# Altium project OpenOBW.PrjPcb
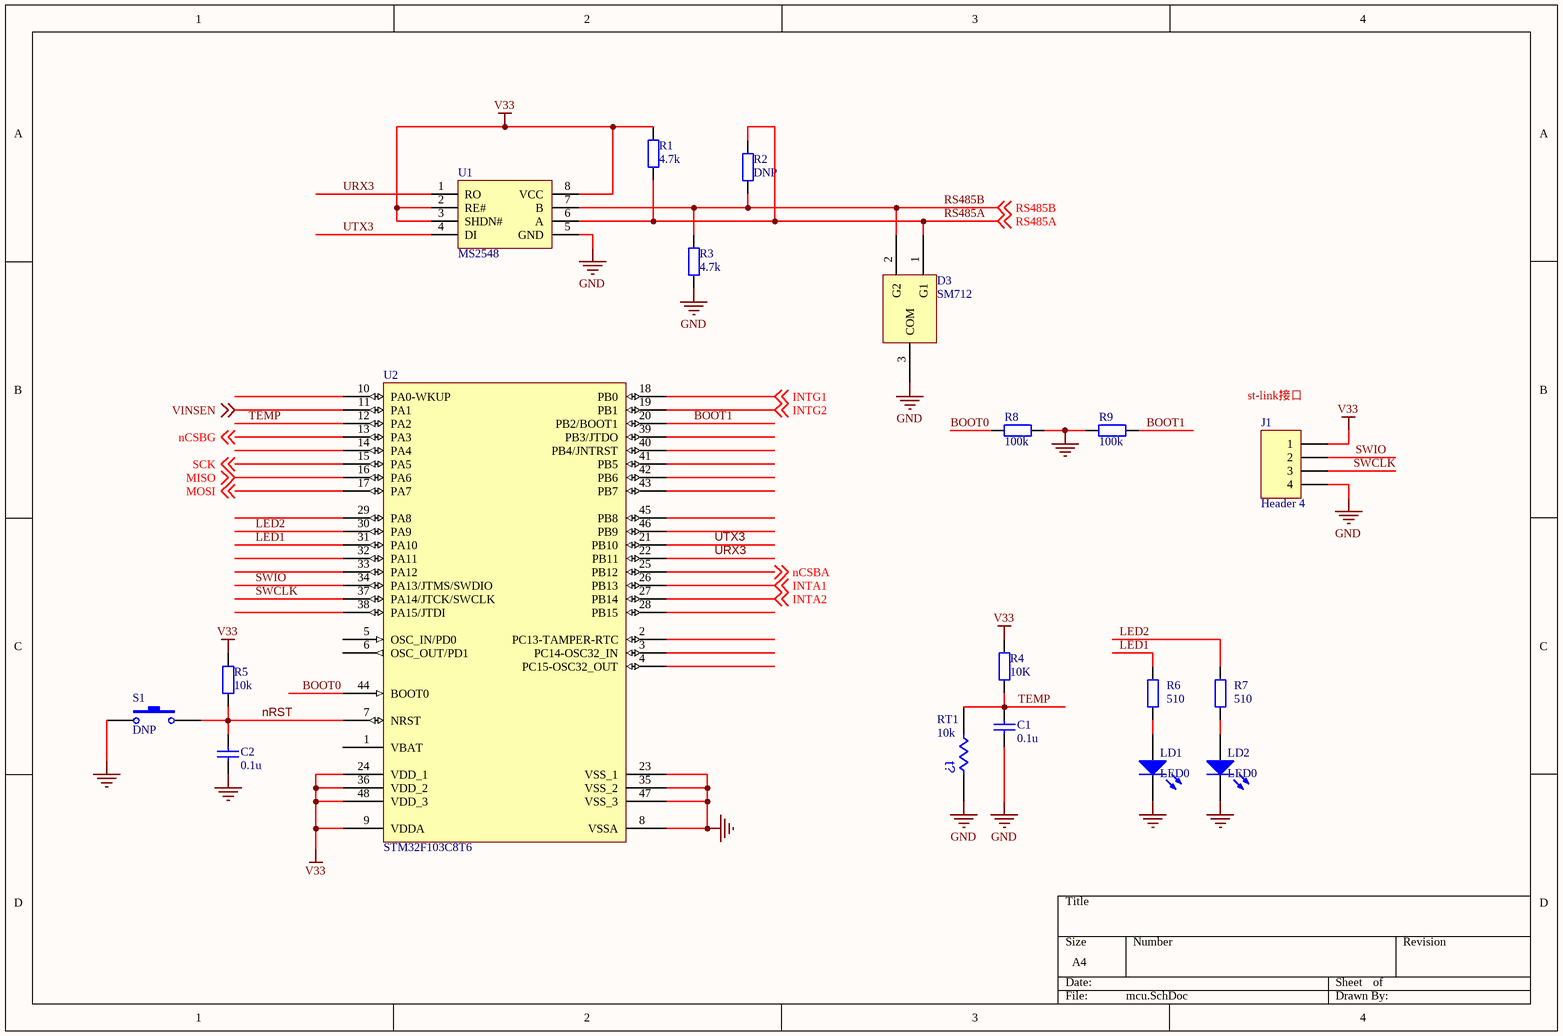
[diagram p0: mcu.SchDoc]
3 sheets, 43 parts. Net scope: global (net labels, ports and power ports of the same name join across sheets).
Board file: OpenOBW.PcbDoc
Sheets:
  mcu.SchDoc
  power.SchDoc
  imu.SchDoc

## Sheet mcu.SchDoc
size A4; SPICEModelCacheXRGICAAV: <root> / <DocumentId>XRGICAAV</DocumentId> / </root>

### Parts
C1  value 0.1u  [0603C]  (hidden comment: Cap)
C2  value 0.1u  [0603C]  (hidden comment: Cap)
D3  SM712  [sot-23]
J1  Header 4  [xhb127-4]
LD1  LED0  [0603d-s]
LD2  LED0  [0603d-s]
R1  value 4.7k  [0603R]  (hidden comment: Res2)
R2  value DNP  [0603R]  (hidden comment: Res2)
R3  value 4.7k  [0603R]  (hidden comment: Res2)
R4  value 10K  [0603R]  (hidden comment: Res2)
R5  value 10k  [0603R]  (hidden comment: Res2)
R6  value 510  [0603R]  (hidden comment: Res2)
R7  value 510  [0603R]  (hidden comment: Res2)
R8  value 100k  [0603R]  (hidden comment: Res2)
R9  value 100k  [0603R]  (hidden comment: Res2)
RT1  10k  [0603R]
S1  DNP  [0603R]
U1  MS2548  [SOIC127P600-8AM]
U2  STM32F103C8T6  [TSQFP50P900X900-48M]

### Nets
GND: C1.1 C2.1 D3.3(COM) J1.4 LD1.2(K) LD2.2(K) R3.1 R8.2 R9.1 RT1.1 S1.1 U1.5(GND) U2.8(VSSA) U2.23(VSS_1) U2.35(VSS_2) U2.47(VSS_3)
V33: J1.1 R1.1 R4.1 R5.2 U1.2(RE#) U1.3(SHDN#) U1.8(VCC) U2.9(VDDA) U2.24(VDD_1) U2.36(VDD_2) U2.48(VDD_3)
BOOT0: R8.1 U2.44(BOOT0)
BOOT1: R9.2 U2.20(PB2/BOOT1)
INTA1: U2.26(PB13) ; off-sheet INTA1
INTA2: U2.27(PB14) ; off-sheet INTA2
INTG1: U2.18(PB0) ; off-sheet INTG1
INTG2: U2.19(PB1) ; off-sheet INTG2
LED1: R6.2 U2.31(PA10)
LED2: R7.2 U2.30(PA9)
MISO: U2.16(PA6) ; off-sheet MISO
MOSI: U2.17(PA7) ; off-sheet MOSI
nCSBA: U2.25(PB12) ; off-sheet nCSBA
nCSBG: U2.13(PA3) ; off-sheet nCSBG
nRST: C2.2 R5.1 S1.2 U2.7(NRST)
RS485A: D3.1(G1) R1.2 R2.2 U1.6(A) ; off-sheet RS485A
RS485B: D3.2(G2) R2.1 R3.2 U1.7(B) ; off-sheet RS485B
SCK: U2.15(PA5) ; off-sheet SCK
SWCLK: J1.3 U2.37(PA14/JTCK/SWCLK)
SWIO: J1.2 U2.34(PA13/JTMS/SWDIO)
TEMP: C1.2 R4.2 RT1.2 U2.12(PA2)
URX3: U1.1(RO) U2.22(PB11)
UTX3: U1.4(DI) U2.21(PB10)
VINSEN: U2.11(PA1) ; off-sheet VINSEN
NetLD1_1: LD1.1(A) R6.1
NetLD2_1: LD2.1(A) R7.1

Not connected (* = marked no-connect by the designer): U2 1(VBAT) 2(PC13-TAMPER-RTC) 3(PC14-OSC32_IN) 4(PC15-OSC32_OUT) 5(OSC_IN/PD0) 6(OSC_OUT/PD1) 10(PA0-WKUP) 14(PA4) 28(PB15) 29(PA8) 32(PA11) 33(PA12) 38(PA15/JTDI) 39(PB3/JTDO) 40(PB4/JNTRST) 41(PB5) 42(PB6) 43(PB7) 45(PB8) 46(PB9)

### Notes on the sheet
- (near J1) st-link接口
- (in symbol Res Thermal) t?

### Library data of the parts
C1 C2 = Cap: Capacitor; Published: 8-Jun-2000; LatestRevisionDate: 17-Jul-2002; LatestRevisionNote: Re-released for DXP Platform.; PackageReference: RAD-0.3; Publisher: Altium Limited; PackageDescription: Radial Cap, Thru-Hole; 2 Leads; 0.3 in Pin Spacing
D3 = SM712: 7V/12V TVS diodes
J1 = Header 4: Header, 4-Pin; LatestRevisionDate: 17-Jul-2002; LatestRevisionNote: Re-released for DXP Platform.; Publisher: Altium Limited
LD1 LD2 = LED0: Typical INFRARED GaAs LED; Published: 8-Jun-2000; LatestRevisionDate: 08-Jul-2005; LatestRevisionNote: Mech Layer 1 removed.; PackageReference: LED-0; Publisher: Altium Limited; PackageDescription: LED; 2 Leads
R1-R9 = Res2: Resistor; Published: 8-Jun-2000; LatestRevisionDate: 17-Jul-2002; LatestRevisionNote: Re-released for DXP Platform.; PackageReference: AXIAL-0.4; Publisher: Altium Limited; PackageDescription: Axial Device, Thru-Hole; 2 Leads; 0.4 in Pin Spacing
RT1 = Res Thermal: Thermistor; Published: 24-Mar-1999; LatestRevisionDate: 29-May-2009; LatestRevisionNote: IPC-7351 Footprint Added.; PackageVersion: Mar-2003; PackageReference: 6-0805; Publisher: Altium Limited; PackageDescription: Chip Resistor 0805 Case Size; Code_IPC: RESC2012
S1 = SW-PB: Switch; Published: 24-Mar-1999; LatestRevisionDate: 17-Jul-2002; LatestRevisionNote: Re-released for DXP Platform.; PackageReference: SPST-2; Publisher: Altium Limited; PackageDescription: Switch; 2 Leads
U1 = MAX13487
U2 = STM32F101C8T6: STM32 ARM-based 32-bit MCU with 64 Kbytes Flash, 48-pin LQFP, Industrial Temperature; Published: 30-May-2008; DatasheetVersion: rev6, Mar-2008; PackageVersion: Mar-2008; PackageReference: LQFP48; Publisher: Altium Limited; PackageDescription: 48-Pin Low-Profile Quad Flat Pack, 7 x 7 mm Body, 0.5 mm Pitch (LQFP48); ComponentLink1Description: Manufacturer Link; ComponentLink1URL: www.st.com/stm32; ComponentLink2Description: Datasheet; ComponentLink2URL: http://www.st.com/stonline/products/literature/ds/13586.pdf

## Sheet power.SchDoc
size A4
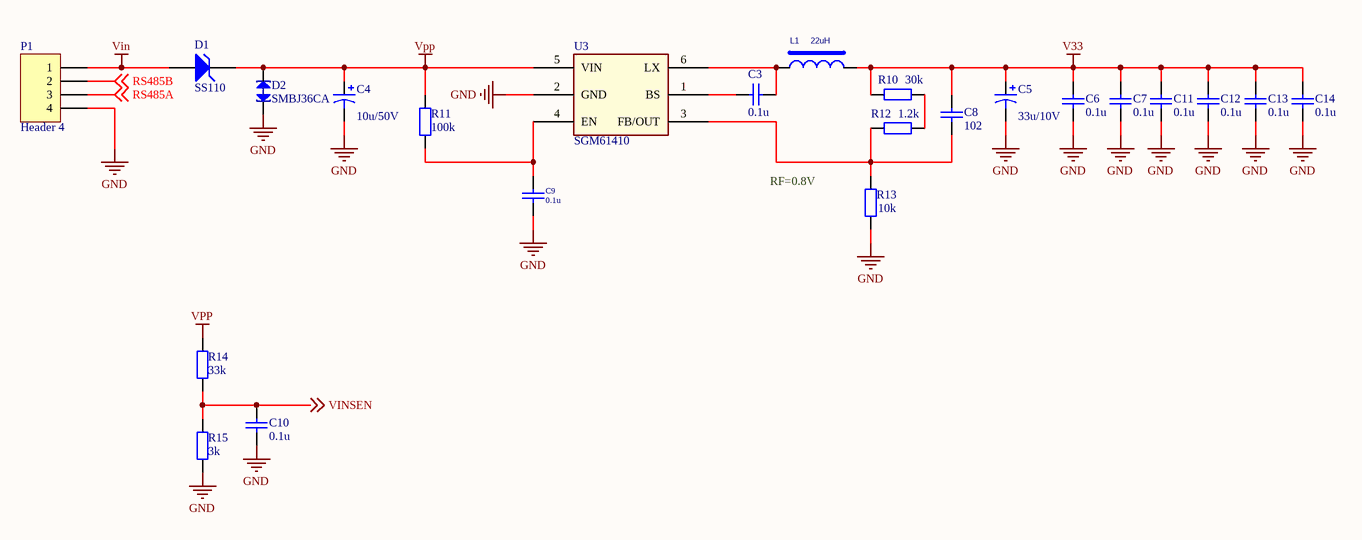
[diagram p1: power.SchDoc]

### Parts
C3  value 0.1u  [0603C]  (hidden comment: Cap)
C4  value 10u/50V  [E0.1]  (hidden comment: Cap Pol1)
C5  value 33u/10V  [E0.1]  (hidden comment: Cap Pol1)
C6  value 0.1u  [0603C]  (hidden comment: Cap)
C7  value 0.1u  [0603C]  (hidden comment: Cap)
C8  value 102  [0603C]  (hidden comment: Cap)
C9  value 0.1u  [0603C]  (hidden comment: Cap)
C10  value 0.1u  [0603C]  (hidden comment: Cap)
C11  value 0.1u  [0603C]  (hidden comment: Cap)
C12  value 0.1u  [0603C]  (hidden comment: Cap)
C13  value 0.1u  [0603C]  (hidden comment: Cap)
C14  value 0.1u  [0603C]  (hidden comment: Cap)
D1  SS110  [SMB]
D2  SMBJ36CA  [SMB]
L1  22uH  [MSS4018]
P1  Header 4  [HDR1X4]
R10  value 30k  [0603R]  (hidden comment: Res2)
R11  value 100k  [0603R]  (hidden comment: Res2)
R12  value 1.2k  [0603R]  (hidden comment: Res2)
R13  value 10k  [0603R]  (hidden comment: Res2)
R14  value 33k  [0603R]  (hidden comment: Res2)
R15  value 3k  [0603R]  (hidden comment: Res2)
U3  SGM61410  [sot-26]

### Nets
GND: C4.2 C5.2 C6.1 C7.1 C9.2 C10.1 C11.1 C12.1 C13.1 C14.1 D2.1(A) P1.4 R13.2 R15.1 U3.2(GND)
V33: C5.1 C6.2 C7.2 C8.2 C11.2 C12.2 C13.2 C14.2 L1.2 R10.1
Vin: D1.1(A) P1.1
VPP: C4.1 D1.2(K) D2.2(A) R11.1 R14.2 U3.5(VIN)
RS485A: P1.3 ; off-sheet RS485A
RS485B: P1.2 ; off-sheet RS485B
VINSEN: C10.2 R14.1 R15.2 ; off-sheet VINSEN
NetC3_1: C3.1 L1.1 U3.6(LX)
NetC3_2: C3.2 U3.1(BS)
NetC8_1: C8.1 R12.1 R13.1 U3.3(FB/OUT)
NetC9_1: C9.1 R11.2 U3.4(EN)
NetR10_2: R10.2 R12.2

### Notes on the sheet
- RF=0.8V

### Library data of the parts
C3 C6-C14 = Cap: Capacitor; Published: 8-Jun-2000; LatestRevisionDate: 17-Jul-2002; LatestRevisionNote: Re-released for DXP Platform.; PackageReference: RAD-0.3; Publisher: Altium Limited; PackageDescription: Radial Cap, Thru-Hole; 2 Leads; 0.3 in Pin Spacing
C4 C5 = Cap Pol1: Polarized Capacitor (Radial); Published: 8-Jun-2000; LatestRevisionDate: 17-Jul-2002; LatestRevisionNote: Re-released for DXP Platform.; PackageReference: RB7.6-15; Publisher: Altium Limited; PackageDescription: Polarized Capacitor (Radial); 2 Leads
D1 = D Zener: Zener Diode; Published: 8-Jun-2000; LatestRevisionDate: 17-Jul-2002; LatestRevisionNote: Re-released for DXP Platform.; PackageReference: DIODE-0.7; Publisher: Altium Limited; PackageDescription: Diode, Thru-Hole; 2 Leads; 0.7 in Pin Spacing
D2 = TVS_B
L1 = INDUCTORS OF FERRITE: Power Inductor,3.3uH,0.2,IND_404030; Manufacturer PN: SWPA4030S3R3MT; Manufacturer: sunlord; DC Resistor: 0.04ohm; Isat: 3.3A; Resonace frequency: 38M; Irms: 2.4A; Tolerance: 20%; Priority: A; Created by: YTL; Part Type: POWER_IND; RK PN: SWPA4030S3R3MT
P1 = Header 4: Header, 4-Pin; LatestRevisionDate: 17-Jul-2002; LatestRevisionNote: Re-released for DXP Platform.; Publisher: Altium Limited
R10-R15 = Res2: Resistor; Published: 8-Jun-2000; LatestRevisionDate: 17-Jul-2002; LatestRevisionNote: Re-released for DXP Platform.; PackageReference: AXIAL-0.4; Publisher: Altium Limited; PackageDescription: Axial Device, Thru-Hole; 2 Leads; 0.4 in Pin Spacing
U3 = RY8310

## Sheet imu.SchDoc
size A4
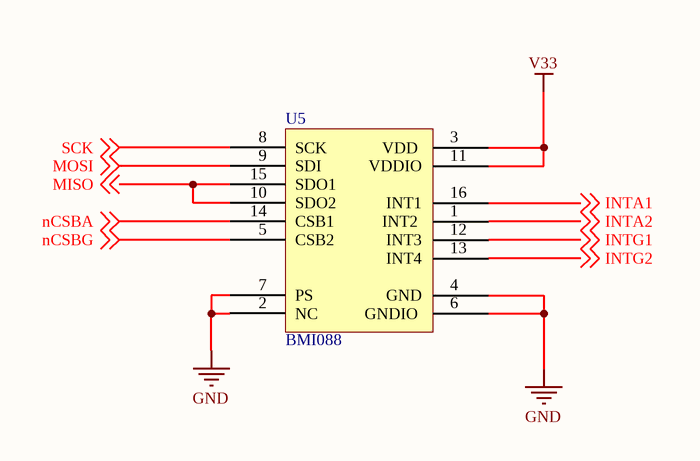
[diagram p2: imu.SchDoc]

### Parts
U5  BMI088  [BMI088]

### Nets
GND: U5.2(NC) U5.4(GND) U5.6(GNDIO) U5.7(PS)
V33: U5.3(VDD) U5.11(VDDIO)
INTA1: U5.16(INT1) ; off-sheet INTA1
INTA2: U5.1(INT2) ; off-sheet INTA2
INTG1: U5.12(INT3) ; off-sheet INTG1
INTG2: U5.13(INT4) ; off-sheet INTG2
MISO: U5.10(SDO2) U5.15(SDO1) ; off-sheet MISO
MOSI: U5.9(SDI) ; off-sheet MOSI
nCSBA: U5.14(CSB1) ; off-sheet nCSBA
nCSBG: U5.5(CSB2) ; off-sheet nCSBG
SCK: U5.8(SCK) ; off-sheet SCK

## Nets that join several sheets
GND: mcu (16 pins), power (15 pins), imu (U5.2 U5.4 U5.6 U5.7)
V33: mcu (11 pins), power (10 pins), imu (U5.3 U5.11)
INTA1: mcu (U2.26), imu (U5.16)
INTA2: mcu (U2.27), imu (U5.1)
INTG1: mcu (U2.18), imu (U5.12)
INTG2: mcu (U2.19), imu (U5.13)
MISO: mcu (U2.16), imu (U5.10 U5.15)
MOSI: mcu (U2.17), imu (U5.9)
nCSBA: mcu (U2.25), imu (U5.14)
nCSBG: mcu (U2.13), imu (U5.5)
RS485A: mcu (D3.1 R1.2 R2.2 U1.6), power (P1.3)
RS485B: mcu (D3.2 R2.1 R3.2 U1.7), power (P1.2)
SCK: mcu (U2.15), imu (U5.8)
VINSEN: mcu (U2.11), power (C10.2 R14.1 R15.2)